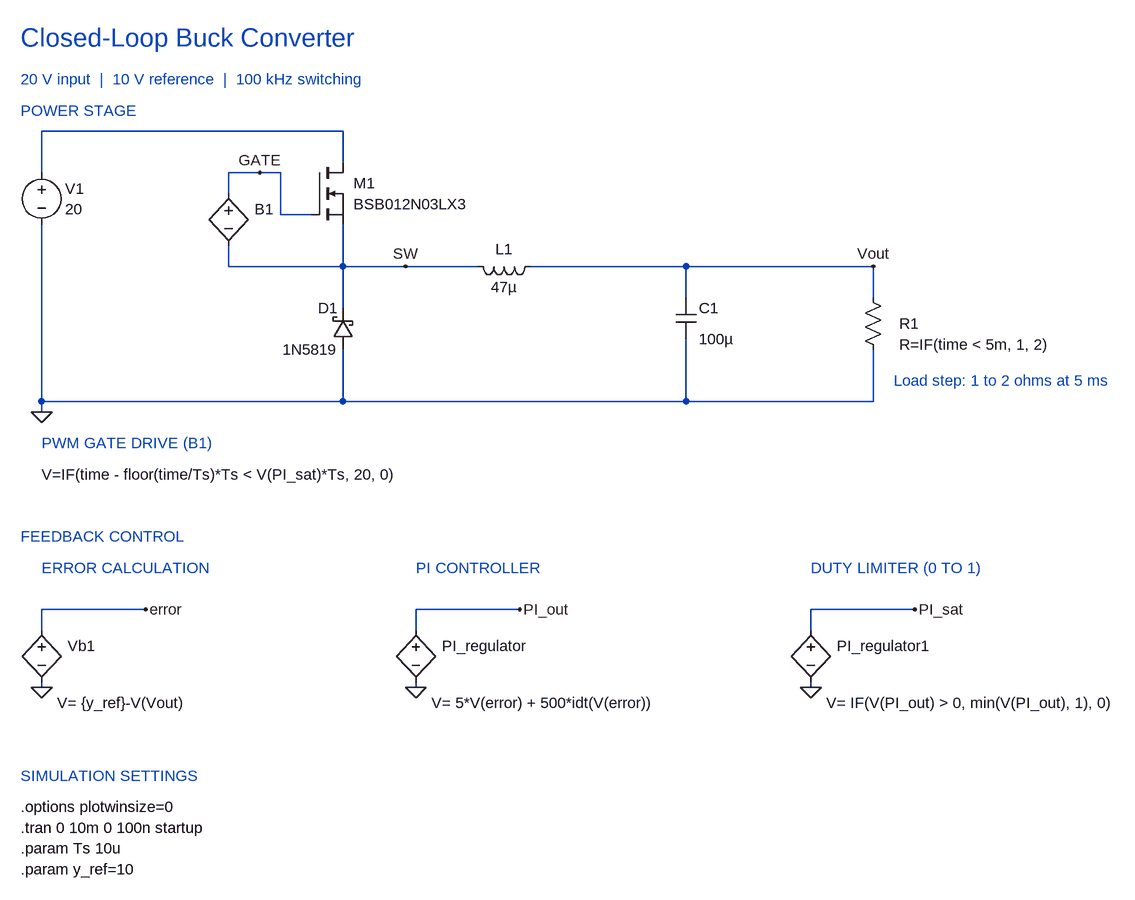
[diagram p0: schematic Closed_Loop_Buck_Converter_Simulation.asc]
Closed_Loop_Buck_Converter_Simulation.asc, the LTspice schematic file:
Version 4
SHEET 1 2048 1408
WIRE 624 192 160 192
WIRE 624 240 624 192
WIRE 160 256 160 192
WIRE 496 256 448 256
WIRE 528 256 496 256
WIRE 448 288 448 256
WIRE 528 320 528 256
WIRE 576 320 528 320
WIRE 448 400 448 368
WIRE 624 400 624 336
WIRE 624 400 448 400
WIRE 720 400 624 400
WIRE 832 400 720 400
WIRE 1152 400 912 400
WIRE 1440 400 1152 400
WIRE 1152 448 1152 400
WIRE 1440 448 1440 400
WIRE 624 464 624 400
WIRE 160 608 160 336
WIRE 624 608 624 528
WIRE 624 608 160 608
WIRE 1152 608 1152 512
WIRE 1152 608 624 608
WIRE 1440 608 1440 528
WIRE 1440 608 1152 608
WIRE 160 624 160 608
WIRE 320 928 160 928
WIRE 896 928 736 928
WIRE 1504 928 1344 928
WIRE 160 960 160 928
WIRE 736 960 736 928
WIRE 1344 960 1344 928
WIRE 160 1048 160 1040
WIRE 736 1048 736 1040
WIRE 1344 1048 1344 1040
FLAG 160 624 0
FLAG 496 256 GATE
FLAG 720 400 SW
FLAG 1440 400 Vout
FLAG 320 928 error
FLAG 160 1048 0
FLAG 896 928 PI_out
FLAG 736 1048 0
FLAG 1504 928 PI_sat
FLAG 1344 1048 0
SYMBOL voltage 160 240 R0
WINDOW 0 36 40 Left 2
WINDOW 3 36 72 Left 2
WINDOW 123 0 0 Left 0
WINDOW 39 0 0 Left 0
SYMATTR InstName V1
SYMATTR Value 20
SYMBOL ind 928 384 R90
WINDOW 0 5 56 VBottom 2
WINDOW 3 32 56 VTop 2
SYMATTR InstName L1
SYMATTR Value 47µ
SYMBOL schottky 640 528 R180
WINDOW 0 24 64 Left 2
WINDOW 3 24 0 Left 2
SYMATTR InstName D1
SYMATTR Value 1N5819
SYMATTR Description Diode
SYMATTR Type diode
SYMBOL cap 1136 448 R0
WINDOW 0 36 16 Left 2
WINDOW 3 36 64 Left 2
SYMATTR InstName C1
SYMATTR Value 100µ
SYMBOL res 1424 432 R0
WINDOW 0 56 56 Left 2
WINDOW 3 56 88 Left 2
SYMATTR InstName R1
SYMATTR Value R=IF(time < 5m, 1, 2)
SYMBOL nmos 576 240 R0
WINDOW 0 64 32 Left 2
WINDOW 3 64 64 Left 2
SYMATTR InstName M1
SYMATTR Value BSB012N03LX3
SYMBOL bv 160 944 R0
WINDOW 0 40 40 Left 2
WINDOW 3 24 128 Left 2
SYMATTR InstName Vb1
SYMATTR Value V= {y_ref}-V(Vout)
SYMBOL bv 736 944 R0
WINDOW 0 40 40 Left 2
WINDOW 3 24 128 Left 2
SYMATTR InstName PI_regulator
SYMATTR Value V= 5*V(error) + 500*idt(V(error))
SYMBOL bv 1344 944 R0
WINDOW 0 40 40 Left 2
WINDOW 3 24 128 Left 2
SYMATTR InstName PI_regulator1
SYMATTR Value V= IF(V(PI_out) > 0, min(V(PI_out), 1), 0)
SYMBOL bv 448 272 R0
WINDOW 0 40 40 Left 2
WINDOW 3 -288 448 Left 2
SYMATTR InstName B1
SYMATTR Value V=IF(time - floor(time/Ts)*Ts < V(PI_sat)*Ts, 20, 0)
TEXT 128 48 Left 4 ;Closed-Loop Buck Converter
TEXT 128 112 Left 2 ;20 V input  |  10 V reference  |  100 kHz switching
TEXT 128 160 Left 2 ;POWER STAGE
TEXT 1472 576 Left 2 ;Load step: 1 to 2 ohms at 5 ms
TEXT 160 672 Left 2 ;PWM GATE DRIVE (B1)
TEXT 128 816 Left 2 ;FEEDBACK CONTROL
TEXT 160 864 Left 2 ;ERROR CALCULATION
TEXT 736 864 Left 2 ;PI CONTROLLER
TEXT 1344 864 Left 2 ;DUTY LIMITER (0 TO 1)
TEXT 128 1184 Left 2 ;SIMULATION SETTINGS
TEXT 128 1232 Left 2 !.options plotwinsize=0
TEXT 128 1264 Left 2 !.tran 0 10m 0 100n startup
TEXT 128 1296 Left 2 !.param Ts 10u
TEXT 128 1328 Left 2 !.param y_ref=10

The netlist it stands for:
* Closed_Loop_Buck_Converter_Simulation.asc
V1 N001 0 20
L1 Vout SW 47µ
D1 0 SW 1N5819
C1 Vout 0 100µ
R1 Vout 0 R=IF(time < 5m, 1, 2)
M1 N001 GATE SW SW BSB012N03LX3
B§Vb1 error 0 V= {y_ref}-V(Vout)
B§PI_regulator PI_out 0 V= 5*V(error) + 500*idt(V(error))
B§PI_regulator1 PI_sat 0 V= IF(V(PI_out) > 0, min(V(PI_out), 1), 0)
B1 GATE SW V=IF(time - floor(time/Ts)*Ts < V(PI_sat)*Ts, 20, 0)
.model D D
.lib standard.dio
.model NMOS NMOS
.model PMOS PMOS
.lib standard.mos
* Closed-Loop Buck Converter
* 20 V input  |  10 V reference  |  100 kHz switching
* POWER STAGE
* Load step: 1 to 2 ohms at 5 ms
* PWM GATE DRIVE (B1)
* FEEDBACK CONTROL
* ERROR CALCULATION
* PI CONTROLLER
* DUTY LIMITER (0 TO 1)
* SIMULATION SETTINGS
.options plotwinsize=0
.tran 0 10m 0 100n startup
.param Ts 10u
.param y_ref=10
.backanno
.end